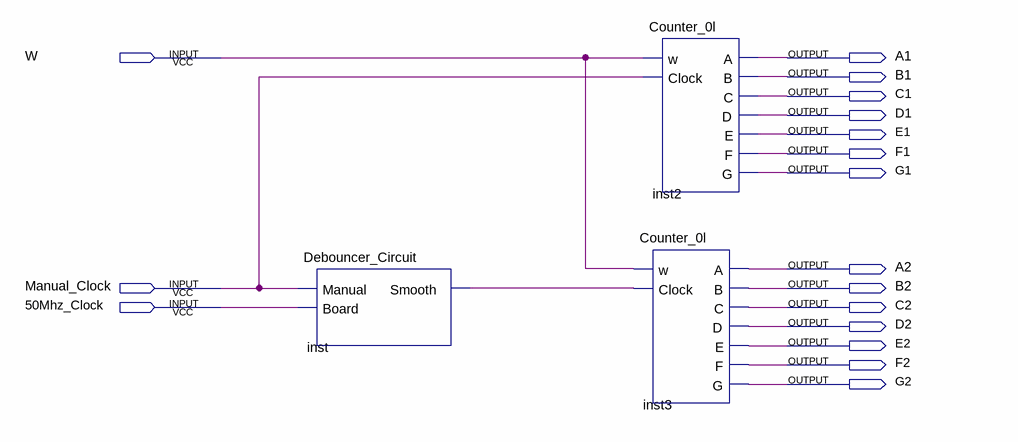
[diagram p0: schematic sheet]
// Quartus schematic Debouncer_In_Use.bdf as structural Verilog: 3 symbols, 17 pins
module Debouncer_In_Use (
  input  W,
  input  Manual_Clock,
  input  \50Mhz_Clock ,
  output A1,
  output B1,
  output C1,
  output D1,
  output E1,
  output F1,
  output G1,
  output A2,
  output B2,
  output C2,
  output D2,
  output E2,
  output F2,
  output G2
);

  wire inst_smooth;

  Debouncer_Circuit inst (.Manual(Manual_Clock), .Board(\50Mhz_Clock ), .Smooth(inst_smooth));
  Counter_0l inst2 (.w(W), .Clock(Manual_Clock), .A(A1), .B(B1), .C(C1), .D(D1), .E(E1), .F(F1), .G(G1));
  Counter_0l inst3 (.w(W), .Clock(inst_smooth), .A(A2), .B(B2), .C(C2), .D(D2), .E(E2), .F(F2), .G(G2));
endmodule
